# Altium project RCW_Daughter.PrjPCB (part 1 of 3)
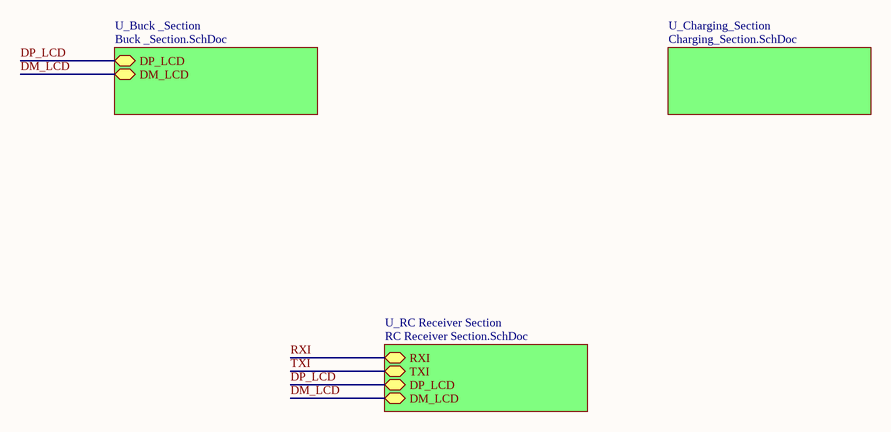
[diagram p0: Top Sheet.SchDoc]
4 sheets, 84 parts. Net scope: hierarchical (ports join the sheet entries above them; power ports are global).
Sheets:
  Top Sheet.SchDoc
    U_Buck _Section = Buck _Section.SchDoc
    U_Charging_Section = Charging_Section.SchDoc
    U_RC Receiver Section = RC Receiver Section.SchDoc

## Sheet Top Sheet.SchDoc
size A4; Organization: Altium Limited; Address1: L3, 12a Rodborough Rd; Address2: Frenchs Forest; Address3: NSW; Address4: Australia 2086; DocumentNumber: 0; SheetNumber: 0; SheetTotal: 4

### Sub-sheets
U_Buck _Section = Buck _Section.SchDoc: DP_LCD (bidir), DM_LCD (bidir)
U_Charging_Section = Charging_Section.SchDoc: no entries
U_RC Receiver Section = RC Receiver Section.SchDoc: RXI (bidir), TXI (bidir), DP_LCD (bidir), DM_LCD (bidir)

### Nets
DM_LCD: sheet U_Buck _Section/DM_LCD, sheet U_RC Receiver Section/DM_LCD
DP_LCD: sheet U_Buck _Section/DP_LCD, sheet U_RC Receiver Section/DP_LCD
RXI: sheet U_RC Receiver Section/RXI
TXI: sheet U_RC Receiver Section/TXI

### Notes on the sheet
- Title
- Size:
- Date:
- A4
- Number:
- Time:
- Revision:
- Sheet
- of
- File:

## Sheet Buck _Section.SchDoc
size A4; Organization: Altium Limited; Address1: L3, 12a Rodborough Rd; Address2: Frenchs Forest; Address3: NSW; Address4: Australia 2086; DocumentNumber: 3; SheetNumber: 3; SheetTotal: 4
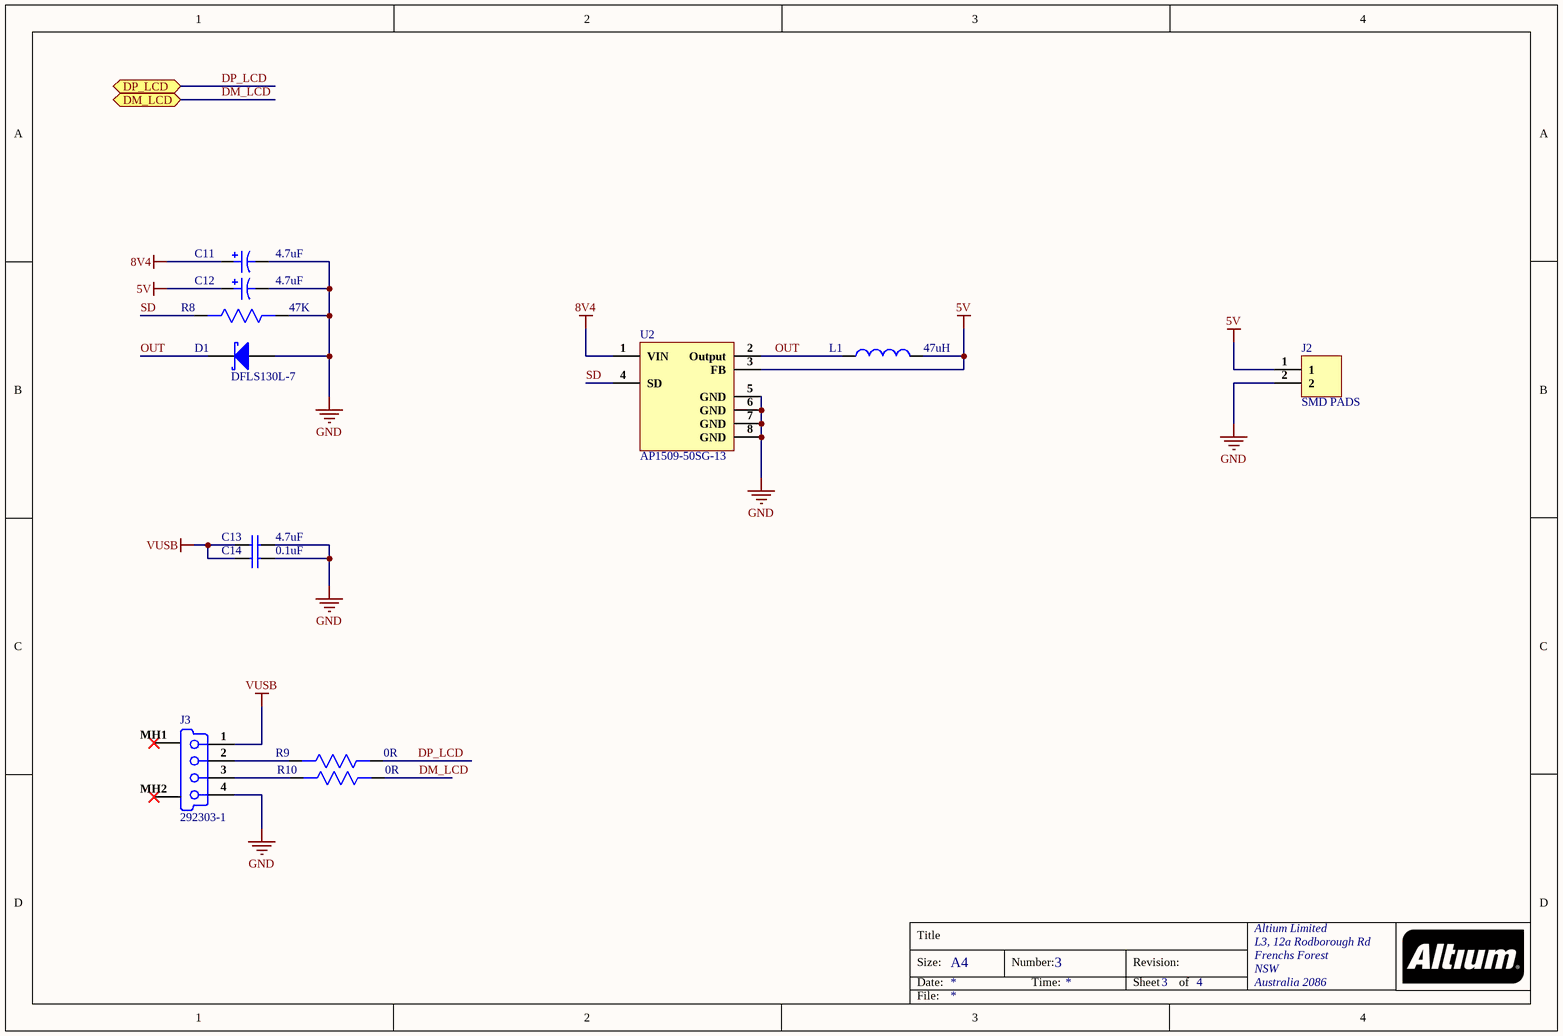
[diagram p1: Buck _Section.SchDoc]

### Parts
C11  4.7uF  [TAJA475K025RNJ]
C12  4.7uF  [TAJA475K025RNJ]
C13  4.7uF  [CAP 0603]
C14  0.1uF  [CAP 0402]
D1  DFLS130L-7  [DFLS130L-7]
J2  SMD PADS  [SMD PAD]
J3  292303-1  [292303-1]
L1  47uH  [GPSR0850-470M]
R8  47K  [Res0402]
R9  0R  [Res0402]
R10  0R  [Res0402]
U2  AP1509-50SG-13  [SOP-8L]

### Ports
DM_LCD (bidir), DP_LCD (bidir)

### Nets
5V: C12.1 J2.1 L1.2 U2.3(FB)
8V4: C11.1 U2.1(VIN)
GND: C11.2 C12.2 C13.2 C14.2 D1.1(A) J2.2 J3.4(NC) R8.1 U2.5(GND) U2.6(GND) U2.7(GND) U2.8(GND)
VUSB: C13.1 C14.1 J3.1(V_BUS_(5V))
DM_LCD: R10.1 ; port DM_LCD
DP_LCD: R9.1 ; port DP_LCD
OUT: D1.2(K) L1.1 U2.2(Output)
SD: R8.2 U2.4(SD)
NetJ3_2: J3.2(D-) R9.2
NetJ3_3: J3.3(D+) R10.2

Not connected (* = marked no-connect by the designer): J3 MH1(Tab)* MH2(Tab)*

### Notes on the sheet
- Title
- Size:
- Date:
- A4
- Number:
- Time:
- Revision:
- Sheet
- of
- File:

### Library data of the parts
C11 C12 = TAJA475K025RNJ: 4.7uF ±10% 25V 3.1 Ω @ 100kHz -55℃ ~ +125℃ CASE-A_3216 Tantalum Capacitors RoHS; Manufacturer: Kyocera AVX; ESR (Equivalent Series Resistance): 3.1R; Leakage Current: 1.2uA; Polarity: Polar; Dissipation Factor: 6%; Supplier 1: Digi-Key; Manufacturer Part Number: TAJA475K025RNJ; Stock 1: 7120; Pricing 1: 1=0.42, 10=0.292, 50=0.204, 100=0.1749, 500=0.13118, 1000=0.11077 (USD); Mount: Surface Mount; Case/Package: 1206; Number of Pins: 2; Case Code (Metric): 3216; Case Code (Imperial): 1206; Dielectric Material: Tantalum; Min Operating Temperature: -55°C; Max Operating Temperature: 125°C; Package Quantity: 2000; Capacitance: 4.7uF; Voltage Rating: 25V; Tolerance: 10%; Packaging: Tape and Reel; Termination: SMD/SMT; Voltage Rating (DC): 25V; Features: General Purpose; Length: 3.2mm; Height: 1.8mm; Width: 0.063inch; Height - Seated (Max): 0.071inch; Depth: 1.6mm; Lead Pitch: 1.1mm; Radiation Hardening: No; REACH SVHC: No SVHC; Lead Free: Lead Free; ComponentLink1URL: http://datasheets.avx.com/TAJ.pdf?src-supplier=Digi-Key; ComponentLink1Description: http://datasheets.avx.com/TAJ.pdf?src-supplier=Digi-Key; ComponentLink2URL: http://www.mouser.com/ds/2/40/taj-776811.pdf?src-supplier=Mouser; ComponentLink2Description: http://www.mouser.com/ds/2/40/taj-776811.pdf?src-supplier=Mouser; ComponentLink3URL: http://www.avx.com/docs/catalogs/taj.pdf?src-supplier=Avnet; ComponentLink3Description: http://www.avx.com/docs/catalogs/taj.pdf?src-supplier=Avnet; Supplier Part Number 1: 478-11053-6-ND
C13 = CC0603KRX5R7BB475: CAP CER 4.7UF 16V X5R 0603; Manufacturer: Yageo; Tolerance: 10%; Supplier 1: Digi-Key; Manufacturer Part Number: CC0603KRX5R7BB475; Stock 1: 1214; Pricing 1: 1=0.53, 10=0.371, 100=0.2446 (USD); Mount: Surface Mount; Case/Package: 0603; Weight: 7.1E-05oz; Case Code (Imperial): 0603; Case Code (Metric): 1608; Min Operating Temperature: -55°C; Max Operating Temperature: 85°C; Capacitance: 4.7uF; Voltage Rating: 16V; Voltage Rating (DC): 16V; Packaging: Tape and Reel; Dielectric: X5R; Termination: SMD/SMT; Composition: Ceramic; Length: 1.6mm; Height: 0.8mm; Width: 0.8mm; Thickness: 0.037inch; Depth: 0.8mm; Lead Free: Lead Free; Halogen Free: Halogen Free; ComponentLink1URL: http://www.mouser.com/ds/2/447/UPY-GPHC_X5R_4V-to-50V_25-1131599.pdf?src-supplier=Mouser; ComponentLink1Description: http://www.mouser.com/ds/2/447/UPY-GPHC_X5R_4V-to-50V_25-1131599.pdf?src-supplier=Mouser; ComponentLink2URL: http://www.yageo.com/documents/recent/UPY-GPHC_X5R_4V-to-50V_25.pdf?src-supplier=Digi-Key; ComponentLink2Description: http://www.yageo.com/documents/recent/UPY-GPHC_X5R_4V-to-50V_25.pdf?src-supplier=Digi-Key; ComponentLink3URL: http://components.arrow.com/part/dataview/0323_04166500?src-supplier=Arrow+Europe; ComponentLink3Description: http://components.arrow.com/part/dataview/0323_04166500?src-supplier=Arrow+Europe; Supplier Part Number 1: 311-1785-1-ND
C14 = CC0402KRX7R7BB104: CAP CER 0.1UF 16V X7R 0402; Manufacturer: Yageo; Tolerance: 10%; Capacitance: 100nF; Supplier 1: Digi-Key; Manufacturer Part Number: CC0402KRX7R7BB104; Stock 1: 9987374; Pricing 1: 1=0.1, 10=0.034, 100=0.015, 500=0.0107, 1000=0.00841, 2500=0.00764, 5000=0.00703 (USD); Mount: Surface Mount; Case/Package: 0402; Number of Pins: 2; Case Code (Metric): 1005; Case Code (Imperial): 0402; Min Operating Temperature: -55°C; Max Operating Temperature: 125°C; Dielectric: X7R; Voltage Rating: 16V; Voltage Rating (DC): 16V; Packaging: Tape and Reel; Package Quantity: 1; Termination: SMD/SMT; Composition: Ceramic; Voltage: 16V; Length: 1mm; Height: 0.5mm; Width: 0.02inch; Thickness: 0.022inch; Depth: 0.5mm; Radiation Hardening: No; REACH SVHC: No SVHC; Lead Free: Lead Free; Halogen Free: Halogen Free; ComponentLink1URL: http://www.yageo.com/documents/recent/UPY-GPHC_X7R_6.3V-to-50V_8.pdf?src-supplier=Avnet+Europe; ComponentLink1Description: http://www.yageo.com/documents/recent/UPY-GPHC_X7R_6.3V-to-50V_8.pdf?src-supplier=Avnet+Europe; ComponentLink2URL: http://www.yageo.com/documents/recent/UPY-GPHC_X7R_6.3V-to-50V_18.pdf?src-supplier=Digi-Key; ComponentLink2Description: http://www.yageo.com/documents/recent/UPY-GPHC_X7R_6.3V-to-50V_18.pdf?src-supplier=Digi-Key; ComponentLink3URL: http://www.yageo.com/documents/recent/UPY-GPHC_X7R_6.3V-to-50V_8.pdf?src-supplier=Avnet; ComponentLink3Description: http://www.yageo.com/documents/recent/UPY-GPHC_X7R_6.3V-to-50V_8.pdf?src-supplier=Avnet; ComponentLink4URL: http://www.yageo.com/documents/recent/UPY-GPHC_X7R_6.3V-to-50V_18.pdf?src-supplier=Mouser; ComponentLink4Description: http://www.yageo.com/documents/recent/UPY-GPHC_X7R_6.3V-to-50V_18.pdf?src-supplier=Mouser; ComponentLink5URL: http://www.farnell.com/datasheets/2167236.pdf?src-supplier=Element14; ComponentLink5Description: http://www.farnell.com/datasheets/2167236.pdf?src-supplier=Element14; ComponentLink6URL: http://www.farnell.com/datasheets/1489800.pdf?src-supplier=Element14; ComponentLink6Description: http://www.farnell.com/datasheets/1489800.pdf?src-supplier=Element14; Supplier Part Number 1: 311-1338-1-ND
D1 = DFLS130L-7: 30V 1A 310mV @ 1A PowerDI 123 Schottky Barrier Diodes (SBD) RoHS; Peak Reverse Current: 1mA; Peak Non-Repetitive Surge Current: 50A; Element Configuration: Single; Max Power Dissipation: 1.67W; Forward Voltage: 360mV; Polarity: Standard; Capacitance: 76pF; Supplier 1: Digi-Key; Manufacturer: Diodes; Manufacturer Part Number: DFLS130L-7; Stock 1: 63236; Pricing 1: 1=0.44, 10=0.379, 25=0.3536, 100=0.2626, 250=0.24948, 500=0.20504, 1000=0.16665 (USD); Mount: Surface Mount; Number of Pins: 2; Contact Plating: Tin,Matte; Min Operating Temperature: -40°C; Max Operating Temperature: 125°C; Forward Current: 1A; Max Repetitive Reverse Voltage (Vrrm): 30V; Package Quantity: 3000; Packaging: Tape and Reel; Average Rectified Current: 1A; Max Forward Surge Current (Ifsm): 50A; Termination: SMD/SMT; Voltage Rating (DC): 30V; Current Rating: 1A; Output Current: 1A; Max Reverse Voltage (DC): 30V; Length: 2.8mm; Height: 0.98mm; Width: 1.78mm; Radiation Hardening: No; REACH SVHC: No SVHC; Lead Free: Lead Free; ComponentLink1URL: http://www.mouser.com/ds/2/115/ds30492-62169.pdf?src-supplier=Mouser; ComponentLink1Description: http://www.mouser.com/ds/2/115/ds30492-62169.pdf?src-supplier=Mouser; ComponentLink2URL: https://www.diodes.com/assets/Datasheets/ds30492.pdf?src-supplier=Digi-Key; ComponentLink2Description: https://www.diodes.com/assets/Datasheets/ds30492.pdf?src-supplier=Digi-Key; ComponentLink3URL: http://www.diodes.com//datasheets/ds30492.pdf?src-supplier=Avnet; ComponentLink3Description: http://www.diodes.com//datasheets/ds30492.pdf?src-supplier=Avnet; ComponentLink4URL: http://www.diodes.com//datasheets/ds30492.pdf?src-supplier=Avnet+Europe; ComponentLink4Description: http://www.diodes.com//datasheets/ds30492.pdf?src-supplier=Avnet+Europe; ComponentLink5URL: http://datasheet.iiic.cc/diodes/DFLS130L-7.pdf?src-supplier=IIIC; ComponentLink5Description: http://datasheet.iiic.cc/diodes/DFLS130L-7.pdf?src-supplier=IIIC; Supplier Part Number 1: DFLS130LDIDKR-ND
J2 = SMD PAD
J3 = 292303-1: USB-A (USB TYPE-A) USB 2.0 Receptacle Connector 4 Position Through Hole, Right Angle; Manufacturer: TE Connectivity; Plating: Bright,Tin; Number of Positions: 4; Number of Ports: 1; Plating Thickness: 0.76um; Contact Current Rating: 1A; Circuit Application: Signal; Connector System: Cable-to-Board; USB Standard: USB 2.0; Insulation Resistance: 1GR; Voltage Rating (AC): 30V; Pitch: 2.5mm; PCB Thickness: 0.062inch; Tail Length: 0.112inch; Approvals: UL; Supplier 1: Digi-Key; Manufacturer Part Number: 292303-1; Stock 1: 19088; Pricing 1: 1=1.49, 10=1.354, 25=1.2716, 50=1.2162, 100=1.161, 250=1.0504, 500=0.96748, 1000=0.82926, 2500=0.77398 (USD); Mount: Through Hole,Horizontal; Contact Plating: Gold; Housing Material: Thermoplastic; Housing Color: Black; Contact Material: Copper Alloy,Copper; Number of Terminals: 4; Color: Black; Min Operating Temperature: -67°C; Max Operating Temperature: 185°C; Packaging: Rail/Tube; Package Quantity: 30; Termination: Through Hole; Gender: Receptacle; Connector Type: Receptacle; Orientation: Right Angle; Number of Contacts: 4; Current Rating: 1A; Length: 14.63mm; Depth: 14mm; REACH SVHC: No SVHC; Flammability Rating: UL94 V-0; Halogen Free: Halogen Free; ComponentLink1URL: http://www.farnell.com/datasheets/1699414.pdf?src-supplier=Farnell; ComponentLink1Description: http://www.farnell.com/datasheets/1699414.pdf?src-supplier=Farnell; ComponentLink2URL: http://www.te.com/commerce/DocumentDelivery/DDEController?Action=showdoc&DocId=Data+Sheet%7F1-1773453-6%7F0908%7Fpdf%7FEnglish%7FENG_DS_1-1773453-6_0908.pdf&src-supplier=Avnet; ComponentLink2Description: http://www.te.com/commerce/DocumentDelivery/DDEController?Action=showdoc&DocId=Data+Sheet%7F1-1773453-6%7F0908%7Fpdf%7FEnglish%7FENG_DS_1-1773453-6_0908.pdf&src-supplier=Avnet; ComponentLink3URL: http://www.te.com/commerce/DocumentDelivery/DDEController?Action=showdoc&DocId=Data+Sheet1-1773453-60908pdfEnglishENG_DS_1-1773453-6_0908.pdf&src-supplier=Avnet+Asia; ComponentLink3Description: http://www.te.com/commerce/DocumentDelivery/DDEController?Action=showdoc&DocId=Data+Sheet1-1773453-60908pdfEnglishENG_DS_1-1773453-6_0908.pdf&src-supplier=Avnet+Asia; ComponentLink4URL: https://www.te.com/commerce/DocumentDelivery/DDEController?Action=srchrtrv&DocNm=292303&DocType=Customer+Drawing&DocLang=English&src-supplier=Digi-Key; ComponentLink4Description: https://www.te.com/commerce/DocumentDelivery/DDEController?Action=srchrtrv&DocNm=292303&DocType=Customer+Drawing&DocLang=English&src-supplier=Digi-Key; ComponentLink5URL: http://www.farnell.com/datasheets/1699414.pdf?src-supplier=Element14; ComponentLink5Description: http://www.farnell.com/datasheets/1699414.pdf?src-supplier=Element14; ComponentLink6URL: http://www.farnell.com/cad/1699210.pdf?src-supplier=Element14; ComponentLink6Description: http://www.farnell.com/cad/1699210.pdf?src-supplier=Element14; ComponentLink7URL: https://www.alliedelec.com/m/d/b8ff6cd1157c72c7c4c41b4704d2a2e6.pdf?src-supplier=Allied+Electronics; ComponentLink7Description: https://www.alliedelec.com/m/d/b8ff6cd1157c72c7c4c41b4704d2a2e6.pdf?src-supplier=Allied+Electronics; ComponentLink8URL: http://www.te.com/commerce/DocumentDelivery/DDEController?Action=showdoc&DocId=Data+Sheet%7F1-1773453-6%7F0908%7Fpdf%7FEnglish%7FENG_DS_1-1773453-6_0908.pdf&src-supplier=Avnet+Europe; ComponentLink8Description: http://www.te.com/commerce/DocumentDelivery/DDEController?Action=showdoc&DocId=Data+Sheet%7F1-1773453-6%7F0908%7Fpdf%7FEnglish%7FENG_DS_1-1773453-6_0908.pdf&src-supplier=Avnet+Europe; ComponentLink9URL: https://www.distrelec.biz/Web/Downloads/07/08/04270708.pdf?mime=application%2Fpdf&src-supplier=Distrelec; ComponentLink9Description: https://www.distrelec.biz/Web/Downloads/07/08/04270708.pdf?mime=application%2Fpdf&src-supplier=Distrelec; ComponentLink10URL: http://www.jameco.com/Jameco/Products/ProdDS/921651.pdf?src-supplier=Jameco; ComponentLink10Description: http://www.jameco.com/Jameco/Products/ProdDS/921651.pdf?src-supplier=Jameco; ComponentLink11URL: http://www.onlinecomponents.com/productFiles/mf-AMP/ddecontrolleractionsrchrtrvdocnm117734536doctypedsdoclan.pdf?src-supplier=Onlinecomponents.com; ComponentLink11Description: http://www.onlinecomponents.com/productFiles/mf-AMP/ddecontrolleractionsrchrtrvdocnm117734536doctypedsdoclan.pdf?src-supplier=Onlinecomponents.com; ComponentLink12URL: http://www.te.com/commerce/DocumentDelivery/DDEController?Action=showdoc&DocId=Customer+Drawing%7F292303%7FE7%7Fpdf%7FEnglish%7FENG_CD_292303_E7.pdf%7F292303-1&src-supplier=Future+Electronics; ComponentLink12Description: http://www.te.com/commerce/DocumentDelivery/DDEController?Action=showdoc&DocId=Customer+Drawing%7F292303%7FE7%7Fpdf%7FEnglish%7FENG_CD_292303_E7.pdf%7F292303-1&src-supplier=Future+Electronics; Supplier Part Number 1: A31726-ND
L1 = GPSR0850-470M: 47uH ±20% 2A 206mΩ SMD,7.8x7.2x5mm Inductors (SMD) RoHS
R8 = ERJ-2RKF4702X: RES SMD 47K OHM 1% 1/10W 0402; Manufacturer: Panasonic; Resistance: 47kR; Temperature Coefficient: 100ppm/°C; Voltage Rating: 50V; Power Rating: 100mW; Supplier 1: Digi-Key; Manufacturer Part Number: ERJ-2RKF4702X; Stock 1: 1741209; Pricing 1: 1=0.1, 10=0.045, 100=0.0183, 1000=0.00822, 2500=0.00713, 5000=0.00589 (USD); Mount: Surface Mount; Case/Package: 0402; Number of Pins: 2; Contact Plating: Tin; Case Code (Imperial): 0402; Case Code (Metric): 1005; Min Operating Temperature: -55°C; Max Operating Temperature: 155°C; Tolerance: 1%; Composition: Thick Film; Packaging: Tape and Reel; Package Quantity: 1; Termination: SMD/SMT; Number of Terminations: 2; Military Standard: Not; Max Power Dissipation: 100mW; Voltage Rating (DC): 50V; Features: Automotive AEC-Q200; Length: 1mm; Height: 0.35mm; Width: 0.5mm; Depth: 0.5mm; Radiation Hardening: No; REACH SVHC: No SVHC; Lead Free: Lead Free; ComponentLink1URL: http://www.farnell.com/datasheets/1911175.pdf?src-supplier=Element14; ComponentLink1Description: http://www.farnell.com/datasheets/1911175.pdf?src-supplier=Element14; ComponentLink2URL: http://industrial.panasonic.com/www-data/pdf/AOA0000/AOA0000CE2.pdf?src-supplier=Avnet; ComponentLink2Description: http://industrial.panasonic.com/www-data/pdf/AOA0000/AOA0000CE2.pdf?src-supplier=Avnet; ComponentLink3URL: http://industrial.panasonic.com/www-data/pdf/AOA0000/AOA0000CE2.pdf?src-supplier=Avnet+Asia; ComponentLink3Description: http://industrial.panasonic.com/www-data/pdf/AOA0000/AOA0000CE2.pdf?src-supplier=Avnet+Asia; ComponentLink4URL: http://www.farnell.com/datasheets/1678782.pdf?src-supplier=Element14; ComponentLink4Description: http://www.farnell.com/datasheets/1678782.pdf?src-supplier=Element14; ComponentLink5URL: http://industrial.panasonic.com/www-data/pdf/AOA0000/AOA0000CE2.pdf?src-supplier=Element14; ComponentLink5Description: http://industrial.panasonic.com/www-data/pdf/AOA0000/AOA0000CE2.pdf?src-supplier=Element14; ComponentLink6URL: https://www.alliedelec.com/m/d/623f45ff1957d936ff56d46fd1c28cac.pdf?src-supplier=Allied+Electronics; ComponentLink6Description: https://www.alliedelec.com/m/d/623f45ff1957d936ff56d46fd1c28cac.pdf?src-supplier=Allied+Electronics; ComponentLink7URL: http://industrial.panasonic.com/cdbs/www-data/pdf/RDA0000/AOA0000C304.pdf?src-supplier=Farnell; ComponentLink7Description: http://industrial.panasonic.com/cdbs/www-data/pdf/RDA0000/AOA0000C304.pdf?src-supplier=Farnell; Supplier Part Number 1: P47.0KLCT-ND
R9 R10 = RC0402JR-070RL: RES SMD 0 OHM JUMPER 1/16W 0402; Manufacturer: Yageo; Manufacturer Part Number: RC0402FR-070RL; Resistance: 0mR; Tolerance: 1%; Power Rating: 62.5mW; Voltage Rating: 50V; Temperature Coefficient: 200ppm/°C; Supplier 1: Digi-Key; Stock 1: 3681314; Pricing 1: 1=0.1, 10=0.013, 25=0.0092, 50=0.0072, 100=0.0053, 250=0.004, 500=0.0032, 1000=0.00236, 5000=0.00169 (USD); Mount: Surface Mount; Case/Package: 0402; Contact Plating: Tin,Matte; Case Code (Imperial): 0402; Case Code (Metric): 1005; Min Operating Temperature: -55°C; Max Operating Temperature: 155°C; Composition: Thick Film; Packaging: Tape and Reel; Termination: SMD/SMT; Length: 1mm; Height: 0.35mm; Width: 0.5mm; Radiation Hardening: No; Lead Free: Lead Free; ComponentLink1URL: http://www.yageo.com/documents/recent/PYu-RC0402_51_RoHS_L_6.pdf?src-supplier=Avnet; ComponentLink1Description: http://www.yageo.com/documents/recent/PYu-RC0402_51_RoHS_L_6.pdf?src-supplier=Avnet; ComponentLink2URL: http://www.yageo.com/documents/recent/PYu-RC0402_51_RoHS_L_6_r.pdf?src-supplier=Future+Electronics; ComponentLink2Description: http://www.yageo.com/documents/recent/PYu-RC0402_51_RoHS_L_6_r.pdf?src-supplier=Future+Electronics; ComponentLink3URL: http://www.yageo.com/documents/recent/PYu-RC0402_51_RoHS_L_6.pdf?src-supplier=Avnet+Europe; ComponentLink3Description: http://www.yageo.com/documents/recent/PYu-RC0402_51_RoHS_L_6.pdf?src-supplier=Avnet+Europe; Supplier Part Number 1: 311-0.0LRCT-ND
U2 = AP1509-50SG-13: Step-Down Positive Fixed 1 2A 150kHz SOP-8_150mil DC-DC Converters RoHS; Manufacturer: Diodes; Number of Outputs: 1; Output Voltage: 5V; Min Input Voltage: 4.5V; Max Input Voltage: 22V; Switching Frequency: 173kHz; Efficiency: 83%; Synchronous Rectifier: No; Operating Supply Current: 5mA; Supplier 1: Digi-Key; Manufacturer Part Number: AP1509-50SG-13; Stock 1: 11210; Pricing 1: 1=1.32, 10=1.18, 25=1.12, 100=0.8599, 250=0.75992, 500=0.71992, 1000=0.55994 (USD); Mount: Surface Mount; Case/Package: SOP; Number of Pins: 8; Weight: 0.030018oz; Contact Plating: Tin,Matte; Min Operating Temperature: -20°C; Max Operating Temperature: 85°C; Max Output Current: 2A; Operating Supply Voltage: 22V; Packaging: Tape and Reel; Package Quantity: 2500; Output Current: 2A; Min Supply Voltage: 4.5V; Nominal Output Voltage: 5V; Min Output Voltage: 5V; Max Output Voltage: 5V; Output Type: Fixed; Output Configuration: Positive; Length: 4.95mm; Height: 1.5mm; Width: 3.95mm; REACH SVHC: No SVHC; Lead Free: Lead Free; ComponentLink1URL: http://www.farnell.com/datasheets/608784.pdf?src-supplier=Element14; ComponentLink1Description: http://www.farnell.com/datasheets/608784.pdf?src-supplier=Element14; Supplier Part Number 1: AP1509-50SGDIDKR-ND